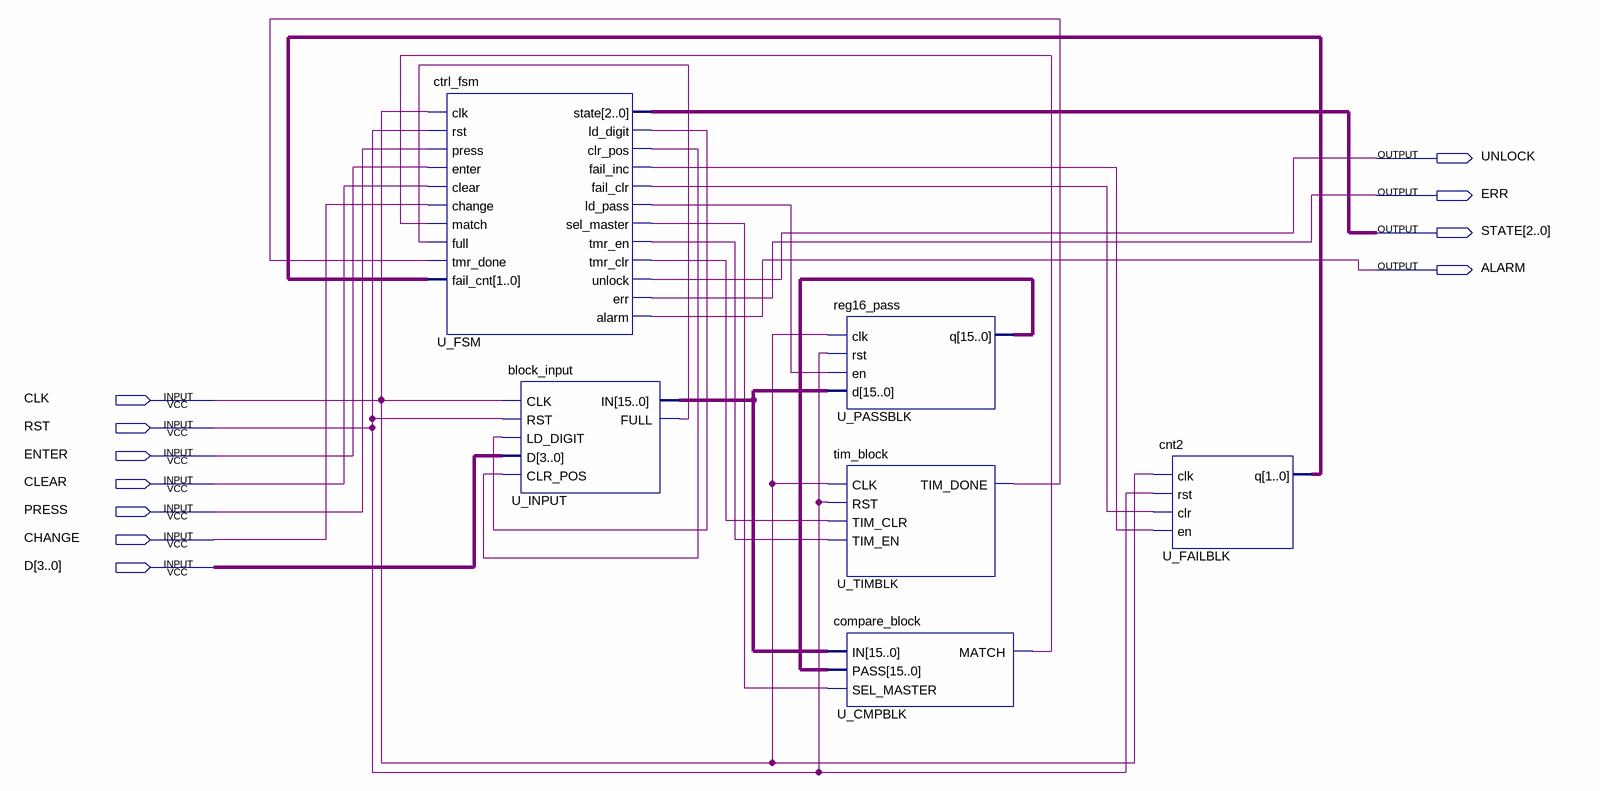
[diagram p0: schematic sheet]
// Quartus schematic CE118.bdf as structural Verilog: 6 symbols, 11 pins
module CE118 (
  input  CLK,
  input  RST,
  input  ENTER,
  input  CLEAR,
  input  PRESS,
  input  CHANGE,
  input  [3:0] D,
  output UNLOCK,
  output ERR,
  output [2:0] STATE,
  output ALARM
);

  wire U_CMPBLK_match, U_FSM_clr_pos, U_FSM_fail_clr, U_FSM_fail_inc, U_FSM_ld_digit, U_FSM_ld_pass,
       U_FSM_sel_master, U_FSM_tmr_clr, U_FSM_tmr_en, U_INPUT_full, U_TIMBLK_tim_done;
  wire [1:0] U_FAILBLK_q;
  wire [15:0] U_INPUT_in, U_PASSBLK_q;

  ctrl_fsm U_FSM (
    .clk(CLK), .rst(RST), .press(PRESS), .enter(ENTER), .clear(CLEAR), .change(CHANGE),
    .match(U_CMPBLK_match), .full(U_INPUT_full), .tmr_done(U_TIMBLK_tim_done), .fail_cnt(U_FAILBLK_q),
    .state(STATE), .ld_digit(U_FSM_ld_digit), .clr_pos(U_FSM_clr_pos), .fail_inc(U_FSM_fail_inc),
    .fail_clr(U_FSM_fail_clr), .ld_pass(U_FSM_ld_pass), .sel_master(U_FSM_sel_master), .tmr_en(U_FSM_tmr_en),
    .tmr_clr(U_FSM_tmr_clr), .unlock(UNLOCK), .err(ERR), .alarm(ALARM));
  block_input U_INPUT (
    .CLK(CLK), .RST(RST), .LD_DIGIT(U_FSM_ld_digit), .D(D), .CLR_POS(U_FSM_clr_pos), .IN(U_INPUT_in),
    .FULL(U_INPUT_full));
  reg16_pass U_PASSBLK (.clk(CLK), .rst(RST), .en(U_FSM_ld_pass), .d(U_INPUT_in), .q(U_PASSBLK_q));
  tim_block U_TIMBLK (
    .CLK(CLK), .RST(RST), .TIM_CLR(U_FSM_tmr_clr), .TIM_EN(U_FSM_tmr_en), .TIM_DONE(U_TIMBLK_tim_done));
  compare_block U_CMPBLK (.IN(U_INPUT_in), .PASS(U_PASSBLK_q), .SEL_MASTER(U_FSM_sel_master), .MATCH(U_CMPBLK_match));
  cnt2 U_FAILBLK (.clk(CLK), .rst(RST), .clr(U_FSM_fail_clr), .en(U_FSM_fail_inc), .q(U_FAILBLK_q));
endmodule
